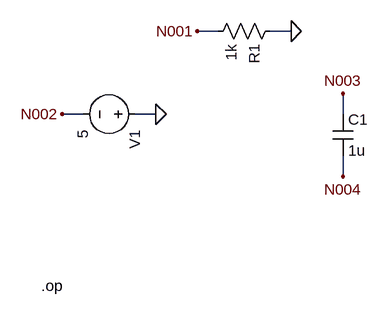
[diagram p0: schematic C3_D1_P1.asc]
C3_D1_P1.asc, the LTspice schematic file:
Version 4
SHEET 1 880 680
WIRE 416 128 448 128
WIRE 208 256 240 256
WIRE 336 128 304 128
WIRE 128 256 96 256
WIRE 528 256 528 224
WIRE 528 320 528 352
FLAG 448 128 0
FLAG 240 256 0
FLAG 304 128 N001
FLAG 96 256 N002
FLAG 528 224 N003
FLAG 528 352 N004
SYMBOL res 432 112 R90
SYMATTR InstName R1
SYMATTR Value 1k
SYMBOL voltage 224 256 R90
SYMATTR InstName V1
SYMATTR Value 5
SYMBOL cap 512 256 R0
SYMATTR InstName C1
SYMATTR Value 1u
TEXT 64 520 Left 2 !.op

The netlist it stands for:
* C3_D1_P1.asc
R1 0 N001 1k
V1 0 N002 5
C1 N003 N004 1u
.op
.backanno
.end